# Altium schematic sheet Memory_Section.SchDoc
size A4; DocumentNumber: 23; SheetNumber: 23; SheetTotal: 27
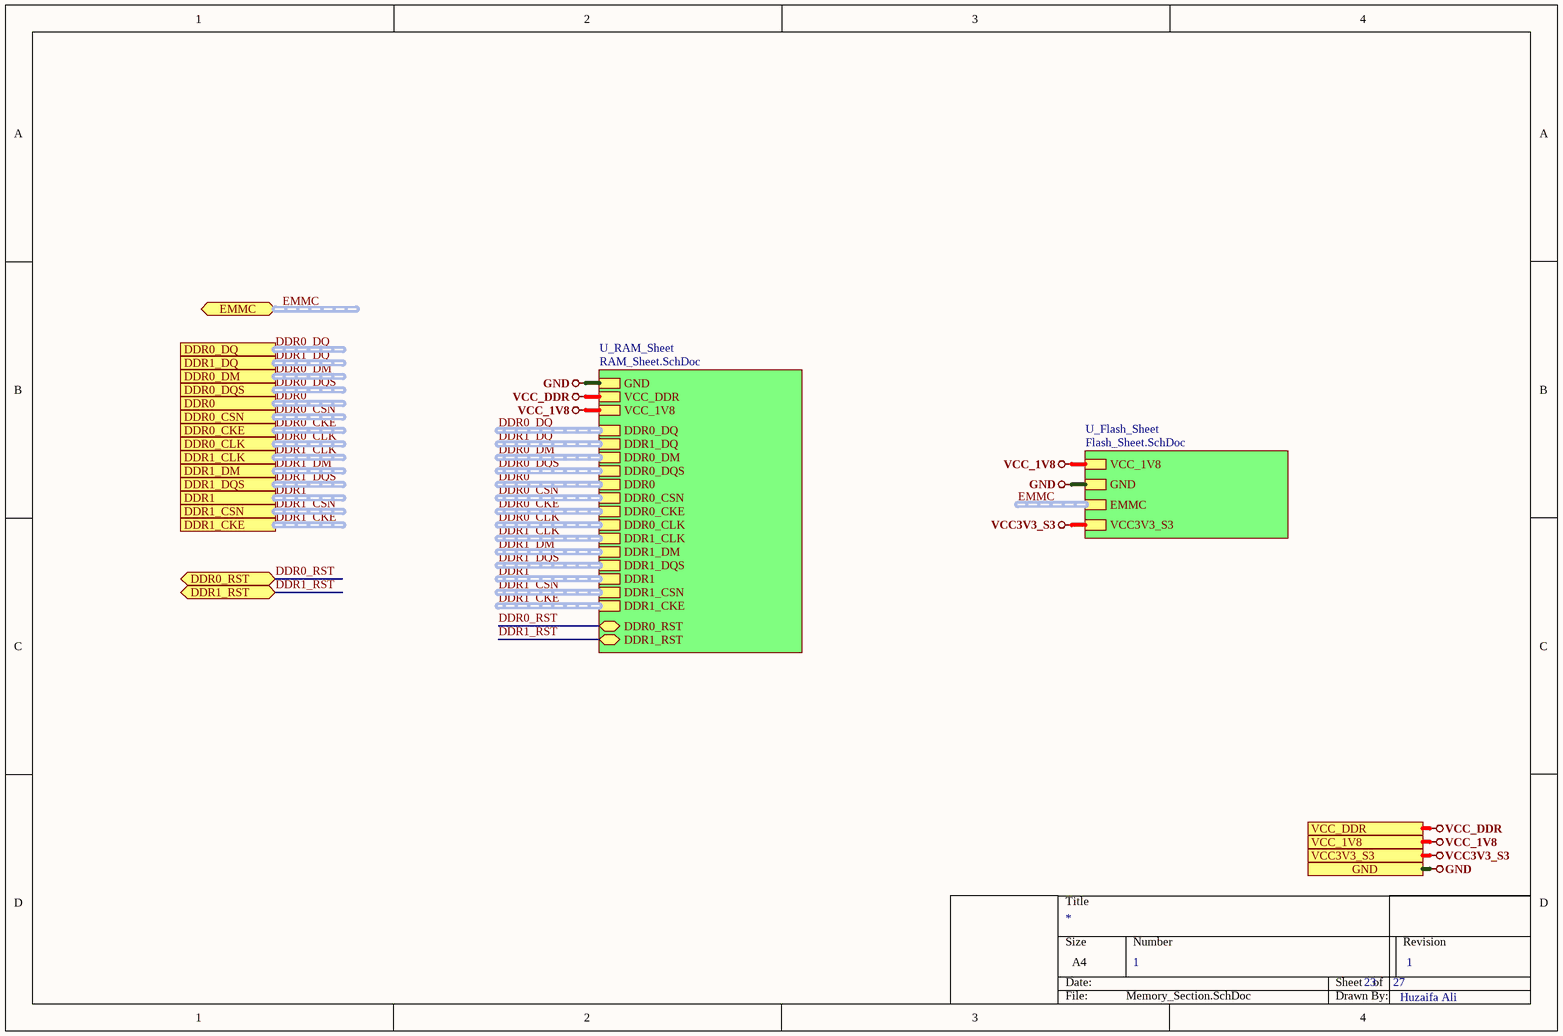
[diagram p0: Memory_Section.SchDoc]

## Sub-sheets
U_Flash_Sheet = Flash_Sheet.SchDoc: VCC_1V8, GND, EMMC (harness EMMC), VCC3V3_S3
U_RAM_Sheet = RAM_Sheet.SchDoc: GND, VCC_DDR, VCC_1V8, DDR0_DQ (harness DDR0_DQ), DDR1_DQ (harness DDR1_DQ), DDR0_DM (harness DDR0_DM), DDR0_DQS (harness DDR0_DQS), DDR0 (harness DDR0), DDR0_CSN (harness DDR0_CSN), DDR0_CKE (harness DDR0_CKE), DDR0_CLK (harness DDR0_CLK), DDR1_CLK (harness DDR1_CLK), DDR1_DM (harness DDR1_DM), DDR1_DQS (harness DDR1_DQS), DDR1 (harness DDR1), DDR1_CSN (harness DDR1_CSN), DDR1_CKE (harness DDR1_CKE), DDR0_RST (bidir), DDR1_RST (bidir)

## Ports
DDR0, DDR0_CKE, DDR0_CLK, DDR0_CSN, DDR0_DM, DDR0_DQ, DDR0_DQS, DDR0_RST (bidir), DDR1, DDR1_CKE, DDR1_CLK, DDR1_CSN, DDR1_DM, DDR1_DQ, DDR1_DQS, DDR1_RST (bidir), EMMC (bidir, harness EMMC), GND, VCC3V3_S3, VCC_1V8, VCC_DDR

## Nets
GND: port GND, sheet U_Flash_Sheet/GND, sheet U_RAM_Sheet/GND
VCC3V3_S3: port VCC3V3_S3, sheet U_Flash_Sheet/VCC3V3_S3
VCC_1V8: port VCC_1V8, sheet U_Flash_Sheet/VCC_1V8, sheet U_RAM_Sheet/VCC_1V8
VCC_DDR: port VCC_DDR, sheet U_RAM_Sheet/VCC_DDR
DDR0_RST: port DDR0_RST, sheet U_RAM_Sheet/DDR0_RST
DDR1_RST: port DDR1_RST, sheet U_RAM_Sheet/DDR1_RST

## Buses and harness runs
harness DDR0 = port DDR0
harness DDR0 = sheet U_RAM_Sheet/DDR0
harness DDR0_CKE = port DDR0_CKE
harness DDR0_CKE = sheet U_RAM_Sheet/DDR0_CKE
harness DDR0_CLK = port DDR0_CLK
harness DDR0_CLK = sheet U_RAM_Sheet/DDR0_CLK
harness DDR0_CSN = port DDR0_CSN
harness DDR0_CSN = sheet U_RAM_Sheet/DDR0_CSN
harness DDR0_DM = port DDR0_DM
harness DDR0_DM = sheet U_RAM_Sheet/DDR0_DM
harness DDR0_DQ = port DDR0_DQ
harness DDR0_DQ = sheet U_RAM_Sheet/DDR0_DQ
harness DDR0_DQS = port DDR0_DQS
harness DDR0_DQS = sheet U_RAM_Sheet/DDR0_DQS
harness DDR1 = port DDR1
harness DDR1 = sheet U_RAM_Sheet/DDR1
harness DDR1_CKE = port DDR1_CKE
harness DDR1_CKE = sheet U_RAM_Sheet/DDR1_CKE
harness DDR1_CLK = port DDR1_CLK
harness DDR1_CLK = sheet U_RAM_Sheet/DDR1_CLK
harness DDR1_CSN = port DDR1_CSN
harness DDR1_CSN = sheet U_RAM_Sheet/DDR1_CSN
harness DDR1_DM = port DDR1_DM
harness DDR1_DM = sheet U_RAM_Sheet/DDR1_DM
harness DDR1_DQ = port DDR1_DQ
harness DDR1_DQ = sheet U_RAM_Sheet/DDR1_DQ
harness DDR1_DQS = port DDR1_DQS
harness DDR1_DQS = sheet U_RAM_Sheet/DDR1_DQS
harness EMMC = port EMMC
harness EMMC = sheet U_Flash_Sheet/EMMC

## Notes on the sheet
- 1
- Huzaifa Ali